# Altium schematic sheet ADC.SchDoc
size A; SheetNumber: 5; SheetTotal: 5
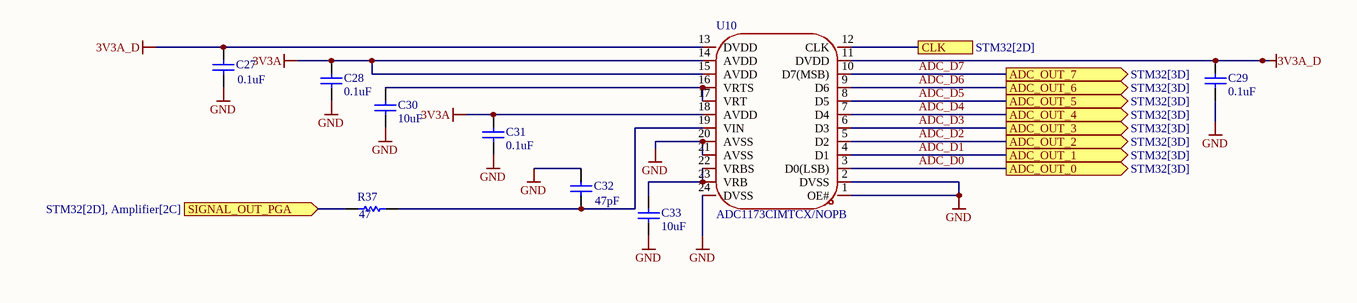
[diagram p0: ADC.SchDoc]

## Parts
C27  value 0.1uF  [0603]  (hidden comment: Cap)
C28  value 0.1uF  [0603]  (hidden comment: Cap)
C29  value 0.1uF  [0603]  (hidden comment: Cap)
C30  value 10uF  [0603]  (hidden comment: Cap)
C31  value 0.1uF  [0603]  (hidden comment: Cap)
C32  value 47pF  [0603]  (hidden comment: Cap)
C33  value 10uF  [0603]  (hidden comment: Cap)
R37  value 47  [0603]  (hidden comment: Res1)
U10  ADC1173CIMTCX/NOPB  [TSSOP-24]

## Ports
ADC_OUT_0 (out, see STM32[3D]), ADC_OUT_1 (out, see STM32[3D]), ADC_OUT_2 (out, see STM32[3D]), ADC_OUT_3 (out, see STM32[3D]), ADC_OUT_4 (out, see STM32[3D]), ADC_OUT_5 (out, see STM32[3D]), ADC_OUT_6 (out, see STM32[3D]), ADC_OUT_7 (out, see STM32[3D]), CLK (see STM32[2D]), SIGNAL_OUT_PGA (in, see STM32[2D], Amplifier[2C])

## Nets
3V3A: C28.1 C31.2 U10.14(AVDD) U10.15(AVDD) U10.18(AVDD)
3V3A_D: C27.1 C29.2 U10.11(DVDD) U10.13(DVDD)
GND: C27.2 C28.2 C29.1 C30.1 C31.1 C32.2 C33.1 U10.1(OE#) U10.2(DVSS) U10.20(AVSS) U10.21(AVSS) U10.24(DVSS)
ADC_D0: U10.3(D0(LSB)) ; port ADC_OUT_0
ADC_D1: U10.4(D1) ; port ADC_OUT_1
ADC_D2: U10.5(D2) ; port ADC_OUT_2
ADC_D3: U10.6(D3) ; port ADC_OUT_3
ADC_D4: U10.7(D4) ; port ADC_OUT_4
ADC_D5: U10.8(D5) ; port ADC_OUT_5
ADC_D6: U10.9(D6) ; port ADC_OUT_6
ADC_D7: U10.10(D7(MSB)) ; port ADC_OUT_7
CLK: U10.12(CLK) ; port CLK
SIGNAL_OUT_PGA: R37.1 ; port SIGNAL_OUT_PGA
NetC30_2: C30.2 U10.16(VRTS) U10.17(VRT)
NetC32_1: C32.1 R37.2 U10.19(VIN)
NetC33_2: C33.2 U10.22(VRBS) U10.23(VRB)

## Library data of the parts
C27-C33 = Cap: Capacitor; Published: 8-Jun-2000; LatestRevisionDate: 17-Jul-2002; LatestRevisionNote: Re-released for DXP Platform.; PackageReference: RAD-0.3; Publisher: Altium Limited; PackageDescription: Radial Cap, Thru-Hole; 2 Leads; 0.3 in Pin Spacing
R37 = Res1: Resistor; Published: 8-Jun-2000; LatestRevisionDate: 17-Jul-2002; LatestRevisionNote: Re-released for DXP Platform.; PackageReference: AXIAL-0.3; Publisher: Altium Limited; PackageDescription: Axial Device, Thru-Hole; 2 Leads; 0.3 in Pin Spacing
U10 = ADC1173CIMTCX/NOPB: 8-bit, 15 MSPS single-channel ADC, 3 V supply